# Altium schematic sheet Power Regulation and Interfaces.SchDoc
size A4; SheetNumber: 1; SheetTotal: 2; SPICEModelCacheAAATKUSZ: <root> / <DocumentId>AAATKUSZ</DocumentId> / <CacheFrame Number="0"> / <Model Name="emk325b7475_nht" Kind="CKT"> / <Text>* EMK325B7475_NHT     SPICE MODEL  ( General Type ) / *-------------------------------------------------------------------------------------------------------- / * Model Generated by TAIYO YUDEN Corporation (http://www.ty-top.com) / * Version 1.0 / * TAIYO YUDEN Control No. 170613 / * Copyright(c) 2017 TAIYO YUDEN CO.,LTD. All Rights Reserved. / *-------------------------------------------------------------------------------------------------------- / * / * Products Name : Multilayer Ceramic Capacitors / * / * Characteristics : / *     Capacitance : 4.7 uF , Rated Voltage : 16V , TCC : X7R / *     Case Size : 3.2 x 2.5 / 0.126 x 0.098 [mm/inch] , Thickness : 1.9 / 0.075 [mm/inch] / *     (Conditions: Temperature = 25 degC , DC Bias Current/Voltage = 0A / 0V) / * / * Frequency Range : 40Hz - 3GHz / * / * External Node Assignments : / * / *  1  o---| |---o  2 / * / *-------------------------------------------------------------------------------------------------------- / .SubCkt EMK325B7475_NHT 1 2 / **************************** / C0 1 110 4.4322u / Cm 1 101 0.18549u / C1 101 102 0.5166u / Rc1 101 102 1.212k / C2 102 103 0.23246u / Rc2 102 103 324.4 / C3 103 110 0.044161u / Rc3 103 110 17.632 / C2m 1 301 0.22169u / C21 301 302 1.4263u / Rc21 301 302 2.8865k / C22 302 303 0.94554u / Rc22 302 303 3.6708k / C23 303 304 0.89694u / Rc23 303 304 3.8182k / C24 304 305 0.63775u / Rc24 304 305 327.79 / C25 305 306 0.52201u / Rc25 305 306 313.07 / C26 306 307 0.23625u / Rc26 306 307 60.171 / C27 307 308 0.21382u / Rc27 307 308 30.452 / C28 308 309 0.12573u / Rc28 308 309 51.023 / C29 309 110 4272.8p / Rc29 309 110 13.367 / Rp0 1 110 106.382978723404Meg / L0 110 120 0.15544n / Lm 120 130 0.41806n / L1 120 121 0.46753n / RL1 121 130 0.26517 / L2 120 122 0.47905n / RL2 122 130 0.25841 / L3 120 123 0.81633n / RL3 123 130 40.755 / CR 120 124 1.2488u / LR 124 125 0.3236n / RR 125 130 24.837m / CL 130 140 3.3935p / LL 130 140 0.14146n / RL 130 140 14.873 / Rs 140 2 4.0745m / **************************** / .ends EMK325B7475_NHT</Text> / </Model> / </CacheFrame> / </root>
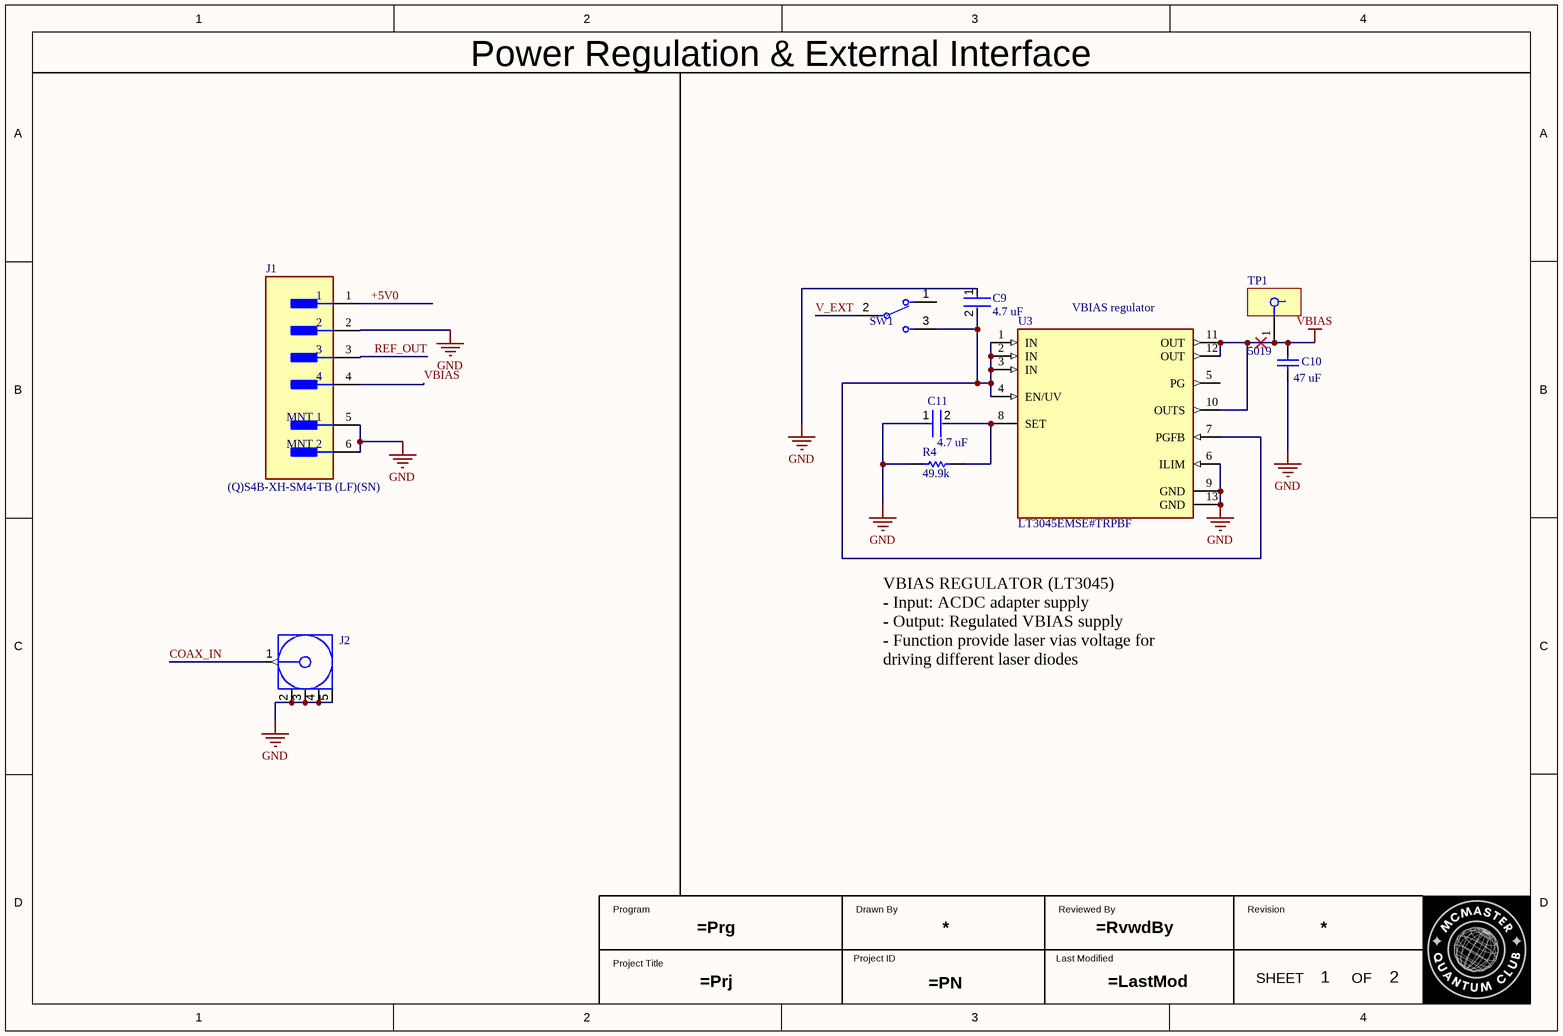
[diagram p0: Power Regulation and Interfaces.SchDoc]

## Parts
C9  4.7 uF  [FP-1210-L_3_2_0_3-W_2_5_0-MFG]
C10  47 uF  [WCAP-CSGP_1206_L3.2W1.6H1.6]
C11  4.7 uF  [FP-1210-L_3_2_0_3-W_2_5_0-MFG]
J1  (Q)S4B-XH-SM4-TB (LF)(SN)  [FP-Q_S4B-XH-SM4-TB_LF-MFG]
J2  60312242114510  [60312242114510]  (value not drawn)
R4  49.9k  [RESC1005X40X25NL05T05]
SW1  JS102011SAQN  [FP-JS102011SAQN-MFG]  (value not drawn)
TP1  5019  [5019_MFG]
U3  LT3045EMSE#TRPBF  [FP-MSE-12-05-08-1666-IPC_B]

## Nets
GND: C9.1 C10.1 C11.1 J1.2 J1.5(MNT_1) J1.6(MNT_2) J2.2(GND) J2.3(GND) J2.4(GND) J2.5(GND) R4.1 U3.6(ILIM) U3.9(GND) U3.13(GND)
VBIAS: C10.2 J1.4 TP1.1 U3.10(OUTS) U3.11(OUT) U3.12(OUT)
+5V0: J1.1
COAX_IN: J2.1(Signal)
REF_OUT: J1.3
V_EXT: SW1.2(C)
NetC9_2: C9.2 SW1.3 U3.1(IN) U3.2(IN) U3.3(IN) U3.4(EN/UV) U3.7(PGFB)
NetC11_2: C11.2 R4.2 U3.8(SET)

Not connected (* = marked no-connect by the designer): SW1 1; U3 5(PG)

## Notes on the sheet
- Power Regulation & External Interface
- (near U3) VBIAS regulator
- Type @ to refer to a designator
- VBIAS REGULATOR (LT3045)
  - Input: ACDC adapter supply
  - Output: Regulated VBIAS supply
  - Function provide laser vias voltage for driving different laser diodes
- Program
- Drawn By
- Reviewed By
- Revision
- Project Title
- Project ID
- Last Modified
- SHEET
- OF

## Library data of the parts
C9 C11 = CMP-14477-002952-2: None; RoHS Compliant: Yes
C10 = CMP-03913-65419936-2: 4.7μF ±10% 25V Ceramic Capacitor X7R 1206 (3216 Metric); Insulation Resistance: 100MΩ; Mount: Surface Mount; Tolerance: 10%; Min Operating Temperature: -55°C; Case Code (Imperial): 1206; RoHS: Compliant; Case Code (Metric): 3216; Case/Package: 1206; Voltage Rating: 25V; Length: 3.2mm; Capacitance: 4.7µF; Thickness: 1.905mm; Height: 1.6mm; Max Operating Temperature: 125°C; Width: 1.6mm
J1 = CMP-17439-000477-1: CONN HEADER SMD R/A 4POS 2.5MM
J2 = CMP-03913-97004434-3: Rf Coax Conn, Sma Jack, 50 Ohm, Pcb Rohs Compliant: Yes; Insertion Loss (dB): 0.14dB; Impedance: 50Ω; Insulation Resistance: 5GΩ; Orientation: Straight; Connector Type: SMA; Max Operating Temperature: 165°C; Insulation Material: PTFE; Min Operating Temperature: -65°C
R4 = CMP-2002-00036-1: Manufacturer: Vishay Dale; Part Number: CRCW0402499KFKTD
SW1 = CMP-2000-06501-2: SWITCH SLIDE SPDT 300MA 6V; Switch Function: On-On; Illumination Type: Non-Illuminated; Switch Travel: 2mm; Contact Resistance: 70mR; Actuator Material: Nylon; Electrical Life: 5000Cycles; Actuator Type: Standard; Max Operating Temperature: 85°C; Housing Material: Nylon; Radiation Hardening: No; Max Voltage Rating (DC): 6V; Package Quantity: 1; Case/Package: 100; Actuator Length: 2mm; Min Operating Temperature: -40°C; Contact Current Rating: 300mA; REACH SVHC: No SVHC; Throw Configuration: SPDT; Packaging: Tape and Reel; Contact Material: Copper Alloy; Max Current Rating: 300mA; Current Rating: 300mA; Mount: Surface Mount; Lead Free: Lead Free; Termination: Gull Wing; Voltage Rating (DC): 6V; Length: 9mm; Orientation: Right Angle; Contact Plating: Silver
TP1 = CMP-1672-00008-3: Phosphor Bronze Contact Miniature Silver Plated Surface Mount Test Points; Number of Contacts: 1; ComponentLink1Description: Manufacturer's Website; Number of Pins: 1; Height: 2.42mm; Mount: Surface Mount; HelpURL: https://www.keyelco.com/product-pdf.cfm?p=1357; REACH SVHC: Yes; Packaging: Tape and Reel; Lead Free: Lead Free; ComponentLink1URL: http://www.keyelco.com/; Termination: SMD/SMT; Material: Bronze; Contact Plating: Silver; Contact Material: Silver; RoHS: Compliant; ComponentLink2URL: https://www.keyelco.com/product-pdf.cfm?p=1357; China RoHS: Compliant; Lifecycle Status: Production; ComponentLink2Description: Datasheet URL
U3 = CMP-09138-000053-1: IC REG LINEAR 0V 500MA 12MSOP; Case/Package: MSOP; RoHS Compliant: Yes